# EAGLE design adafruit-4682-source (EAGLE 9.6.2)
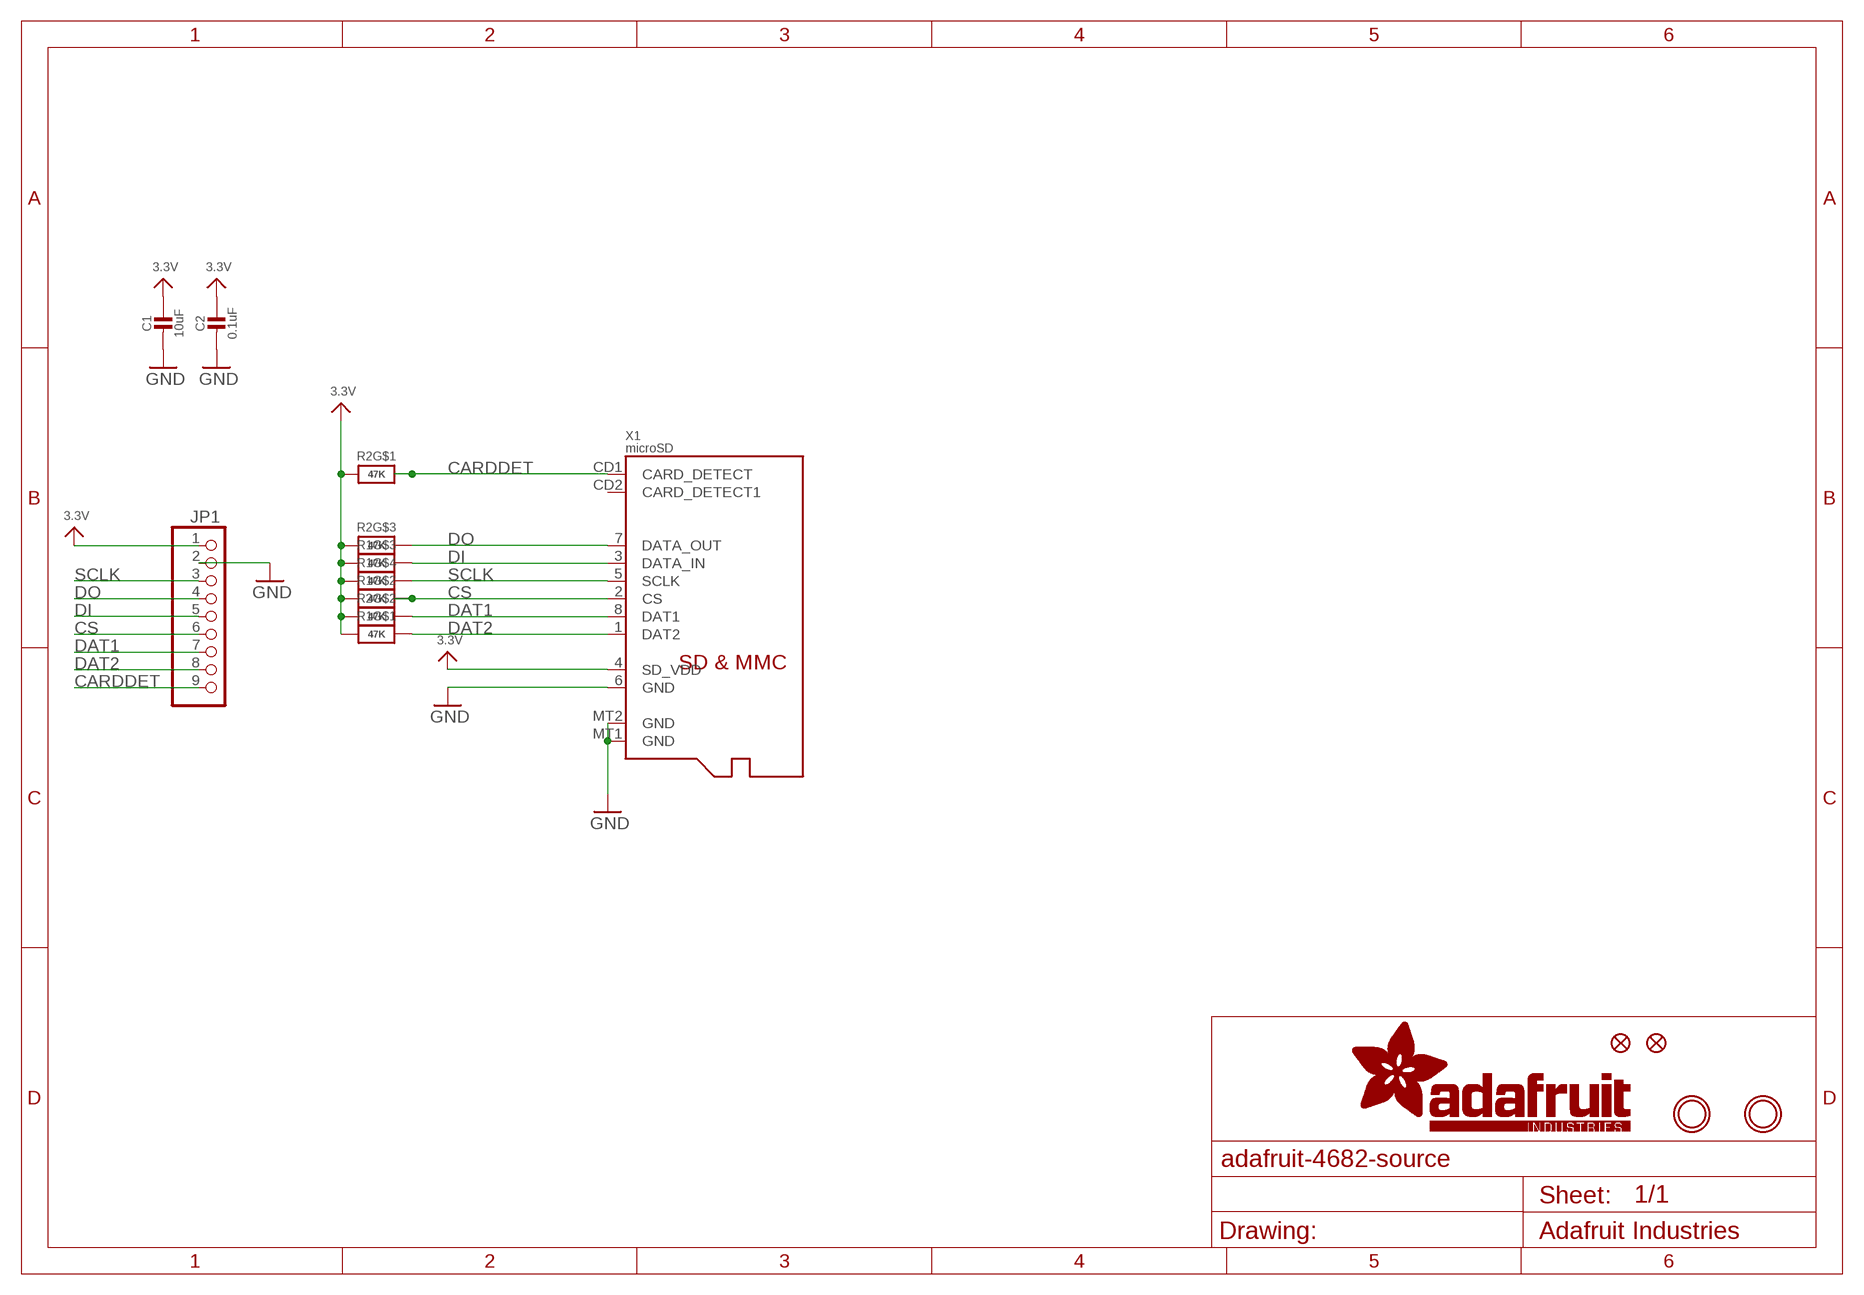
[diagram p0: schematic, sheet 1]

## Parts
C1  10uF  CAP_CERAMIC0805-NOOUTLINE  [0805-NO]
C2  0.1uF  CAP_CERAMIC0603_NO  [0603-NO]
FID1  FIDUCIAL""  [FIDUCIAL_1MM]
FID2  FIDUCIAL""  [FIDUCIAL_1MM]
JP1  HEADER-1X970MIL  [1X09_ROUND_70]
R1  47K  RESISTOR_4PACK  [RESPACK_4X0603]
R2  47K  RESISTOR_4PACK  [RESPACK_4X0603]
U$1  MOUNTINGHOLE2.5  [MOUNTINGHOLE_2.5_PLATED]
U$2  MOUNTINGHOLE2.5  [MOUNTINGHOLE_2.5_PLATED]
X1  microSD  MICROSD  [MICROSD]

## Nets
3.3V: C1.1 C2.1 JP1.1 R1.1 R1.2 R1.3 R1.4 R2.1 R2.2 R2.3 X1.4(SD_VDD)
CARDDET: JP1.9 R2.8 X1.CD1(CARD_DETECT)
CS: JP1.6 R1.7 X1.2(CS)
DAT1: JP1.7 R2.7 X1.8(DAT1)
DAT2: JP1.8 R1.8 X1.1(DAT2)
DI: JP1.5 R1.6 X1.3(DATA_IN)
DO: JP1.4 R2.6 X1.7(DATA_OUT)
GND: C1.2 C2.2 JP1.2 X1.6(GND) X1.MT1(GND) X1.MT2(GND)
SCLK: JP1.3 R1.5 X1.5(SCLK)
Unconnected: R2.4 R2.5 X1.CD2(CARD_DETECT1)

## Library data of the parts
C1 C2 = microbuilder:CAP_CERAMIC: Ceramic Capacitors For new designs, use the packages preceded by an '_' character since they are more reliable: The following footprints should be used on most boards: _0402 - Standard footprint for regular board layouts _0603 - Standard footprint for regular board layouts _0805 - Standard footprint for regular board layouts _1206 - Standard footprint for regular board layouts For extremely tight-pitch boards where space is at a premium, the following 'micro-pitch' footprints can be used (smaller pads, no silkscreen outline, etc.): _0402MP - Micro-pitch footprint for very dense/compact boards _0603MP - Micro-pitch footprint for very dense/compact boards _0805MP - Micro-pitch footprint for very dense/compact boards _1206MP - Micro-pitch footprint for very dense/compact boards
FID1 FID2 = microbuilder:FIDUCIAL: Fiducial Alignment Points Various fiducial points for machine vision alignment.; BOM: EXCLUDE
JP1 = microbuilder:HEADER-1X9: PIN HEADER
R1 R2 = microbuilder:RESISTOR_4PACK: Resistor Packs (4 resistors) 4 x 0603 10K 1/16W - Digikey: YC164J-10KCT-ND
U$1 U$2 = microbuilder:MOUNTINGHOLE: Mounting Hole For #2 screws (0.086"/2.18mm width, 0.094"/2.4mm hole) use 2.5mm; BOM: EXCLUDE
X1 = microbuilder:MICROSD: MicroSD/Transflash Card Holder with SPI pinout 3M: 2908-05WB-MG 4UConnector: 19656 Footprint courtesy: Adafruit Industries

## Board
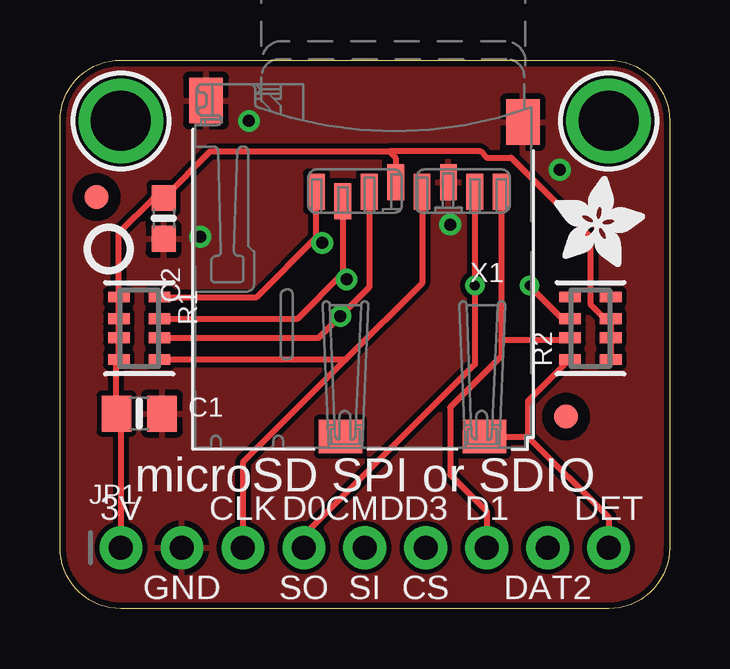
[diagram p1: board, top side]
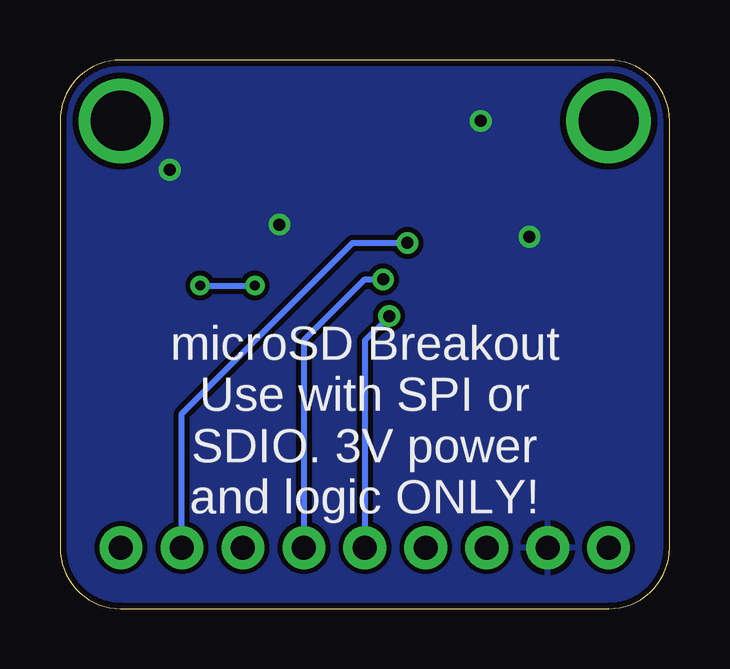
[diagram p2: board, bottom side, seen from below]

Size 25.4 x 22.86 mm. Coordinates in mm from the lower left corner, seen from the top.
Outline: 25.4,20.32 25.4,2.54 arc-90 22.86,0 2.54,0 arc-90 0,2.54 0,20.32 arc-90 2.54,22.86 22.86,22.86 arc-90 25.4,20.32
Copper layers (1*16): Top 0.035mm / dielectric 1.5mm / Bottom 0.035mm
Design rules "adafruit 7-7": minimum track width 6mil, minimum drill 15.5mil, track to track 8mil, track to pad 7mil, pad to pad 7mil, via to via 7mil, smd to smd 7mil, copper to edge 10mil, drill to drill 8mil, minimum pad ring 10mil, minimum via ring 8mil, stop-mask expansion 2mil, vias tented up to drill 20mil, thermal gap 10mil

### Footprints (pad centres in the part's own frame; a part is rotated, then mirrored left to right if it is on the bottom)
0805-NO = smd 1.24 x 1.5: 1 -0.95,0; 2 0.95,0
0603-NO = smd 1.075 x 1: 1 -0.85,0; 2 0.85,0
FIDUCIAL_1MM = smd 1 x 1: 1 0,0
1X09_ROUND_70 = drill 1 pad 1.778: 1 -10.16,0; 2 -7.62,0; 3 -5.08,0; 4 -2.54,0; 5 0,0; 6 2.54,0; 7 5.08,0; 8 7.62,0; 9 10.16,0
RESPACK_4X0603 = smd 0.45 x 0.9: 1 -1.3,-0.85; 2 -0.4,-0.85; 3 0.4,-0.85; 4 1.3,-0.85; 5 1.3,0.85; 6 0.4,0.85; 7 -0.4,0.85; 8 -1.3,0.85
MOUNTINGHOLE_2.5_PLATED = drill 2.5 pad 3.2: P$1 0,0
MICROSD = smd 0.7 x 1.5: 1 9,-10.64; 2 7.9,-10.24; 3 6.8,-10.64; 4 5.7,-11.04; 5 4.6,-10.64; 6 3.5,-11.04; 7 2.4,-10.64; 8 1.3,-10.64 | smd 1.8 x 1.4: CD1 2,-0.44; CD2 8,-0.44 | smd 1.4 x 1.9: MT1 0.4,-13.54; MT2 13.6,-14.44

### Placement (x,y rotation side)
C1  3.3,8.13 0 top
C2  4.32,16.26 270 top
FID1  1.52,17.14 0 top
FID2  21.08,8 0 top
JP1  12.7,2.54 0 top
R1  3.3,11.68 270 top
R2  22.1,11.68 90 top
U$1  2.54,20.32 0 top
U$2  22.86,20.32 0 top
U$4  [ADAFRUIT_3.5MM]  20.57,14.22 0 top
U$7  [PCBFEAT-REV-040]  2.03,14.99 0 top
X1  19.68,6.73 180 top

### Tracks (layer width: path | path; a pad name or v marks a point on that pad's centre or on a via)
3.3V
  Top 0.254: JP1.1 2.54,6.1 2.54,8.13 C1.1 2.35,10.28 R1.4 R1.3 R1.2 R1.1 2.45,15.66 3.9,17.11 C2.1 6.26,19.05 13.72,19.05 | X1.4 13.98,18.78 13.72,19.05 | 13.72,19.05 17.53,19.05 17.78,18.8 18.8,18.8 22.1,15.49 22.1,12.69 22.71,12.08 R2.3 R2.2 R2.1
CARDDET
  Top 0.254: JP1.9 22.86,3.81 19.5,7.17 | X1.CD1 19.5,7.17 | R2.8 19.5,8.63 19.5,7.17
CS  (via drill 0.5)
  Top 0.254: X1.2 11.79,13.97 | 11.79,13.97 11.79,13.87 v11.94,13.72 | R1.7 9.9,12.08 11.79,13.97
  Bottom 0.254: v11.94,13.72 12.7,13.72 15.24,11.18 JP1.6
DAT1
  Top 0.254: X1.8 18.39,11.18 | 18.39,11.18 18.39,10.51 16.26,8.38 16.26,5.59 17.78,4.06 JP1.7 | R2.7 21.14,11.18 18.39,11.18
DAT2  (via drill 0.5)
  Top 0.254: v10.92,15.24 10.69,15.48 | 10.69,15.48 X1.1 | R1.8 8.19,12.98 10.69,15.48
  Bottom 0.254: JP1.8 20.32,8.13 13.21,15.24 v10.92,15.24
DI  (via drill 0.5)
  Top 0.254: X1.3 12.88,13.39 v11.68,12.19 10.78,11.28 R1.6
  Bottom 0.254: v11.68,12.19 12.7,11.18 JP1.5
DO  (via drill 0.41)
  Top 0.254: JP1.4 10.16,3.05 17.29,10.17 v17.29,13.46 X1.7 | R2.6 20.94,12.08 v19.56,13.46
  Bottom 0.254: v19.56,13.46 v17.29,13.46
GND  (via drill 0.5)
  other vias: 7.87,20.32 5.84,15.49 20.83,18.29 16.26,16
  pour Top: 0,22.86 25.4,22.86 25.4,0 0,0
  pour Bottom: 0,22.86 25.4,22.86 25.4,0 0,0
SCLK
  Top 0.254: X1.5 15.09,13.56 11.91,10.38 | JP1.3 7.62,6.1 11.91,10.38 | R1.5 11.91,10.38

### Text on the board
tPlace: microSD SPI or SDIO | 3V | CLK | D0 | CMD | D3 | D1 | DET | GND | SO | SI | CS | DAT2
bPlace: microSD Breakout / Use with SPI or / SDIO. 3V power / and logic ONLY!